# Altium schematic sheet Vibration_Datalogger_1.SchDoc: Title (part 1 of 7)
size 594 x 420 mm; CheckedBy: None; Author: *******; Engineer: *******; DocumentNumber: Doc Num; Revision: *******; SheetNumber: 1; SheetTotal: 1; Date: *******; ApprovedBy: *******; CompanyName: *******; DrawnBy: Name; Organization: *******; Address1: *******; Address2: *******; Address3: *******; Address4: *******; CurrentDate: *******; DocumentName: *******; CurrentTime: *******; Time: *******; DocumentFullPathAndName: *******; ModifiedDate: *******; ImagePath: *******; ProjectName: *******; Application_BuildNumber: *******
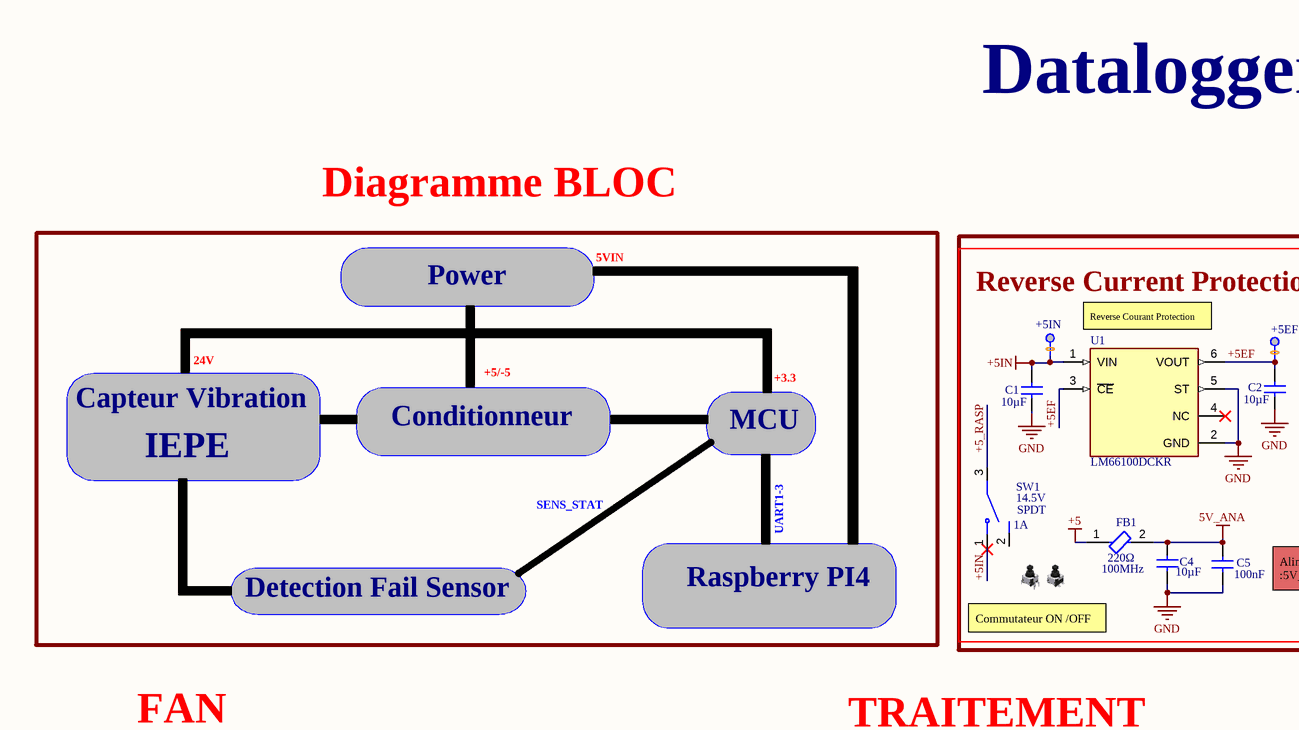
[diagram p0: Vibration_Datalogger_1.SchDoc, top left]
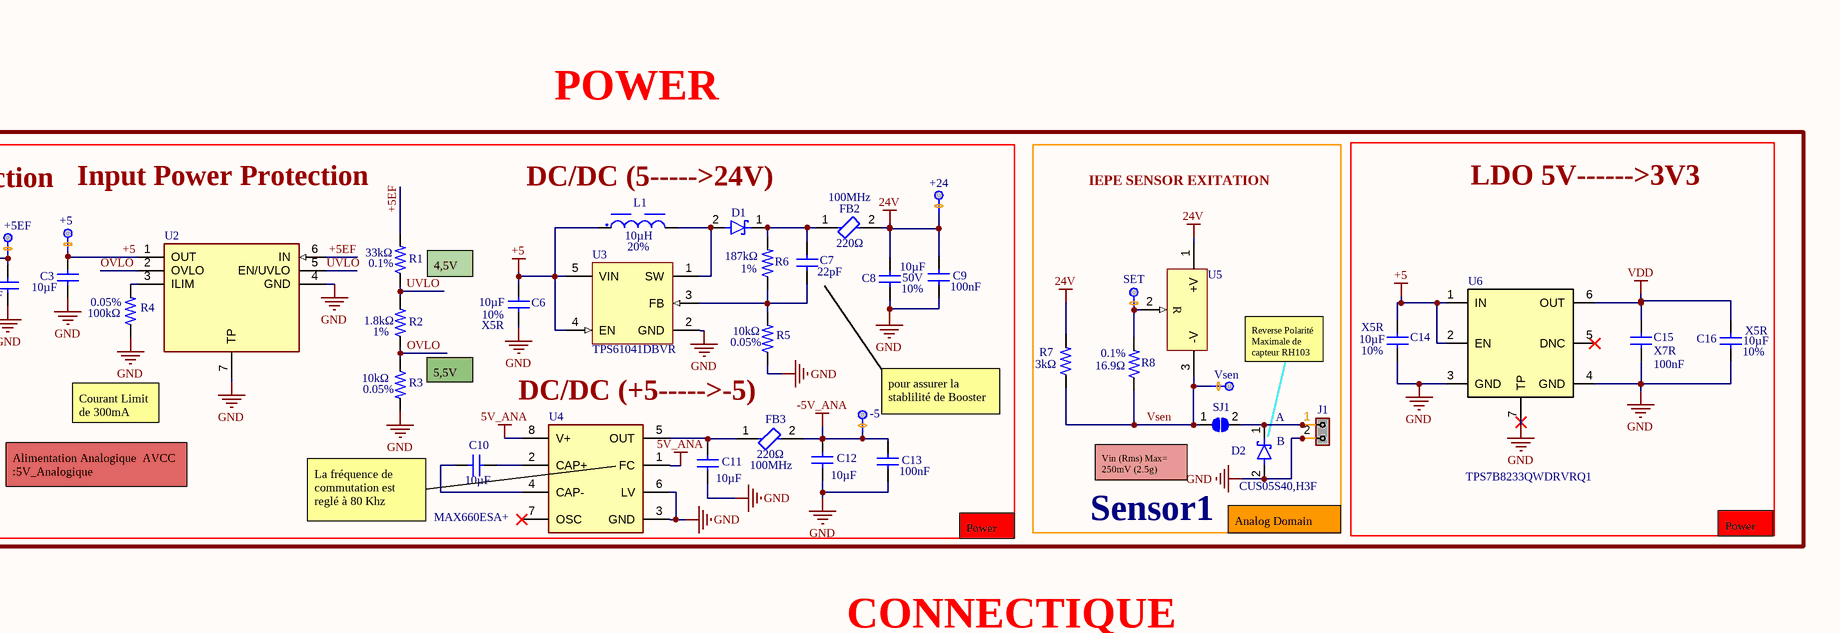
[diagram p1: Vibration_Datalogger_1.SchDoc, top right]
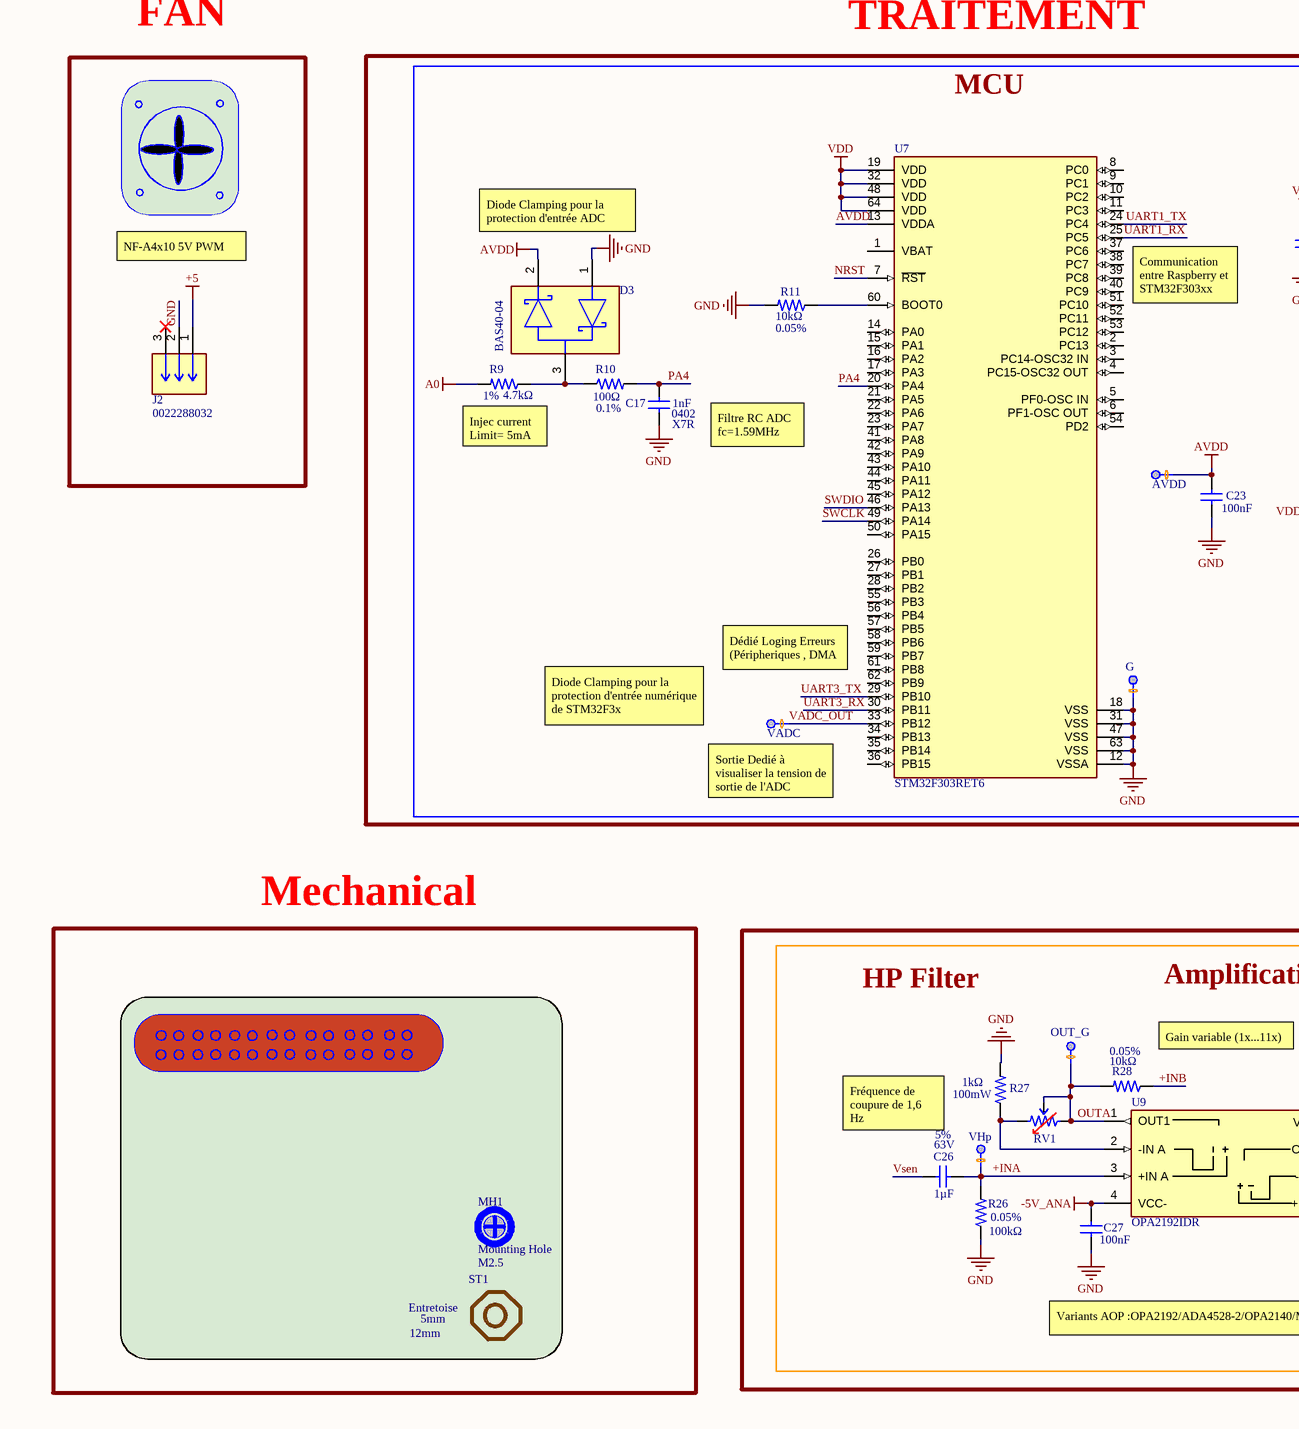
[diagram p2: Vibration_Datalogger_1.SchDoc, bottom left]
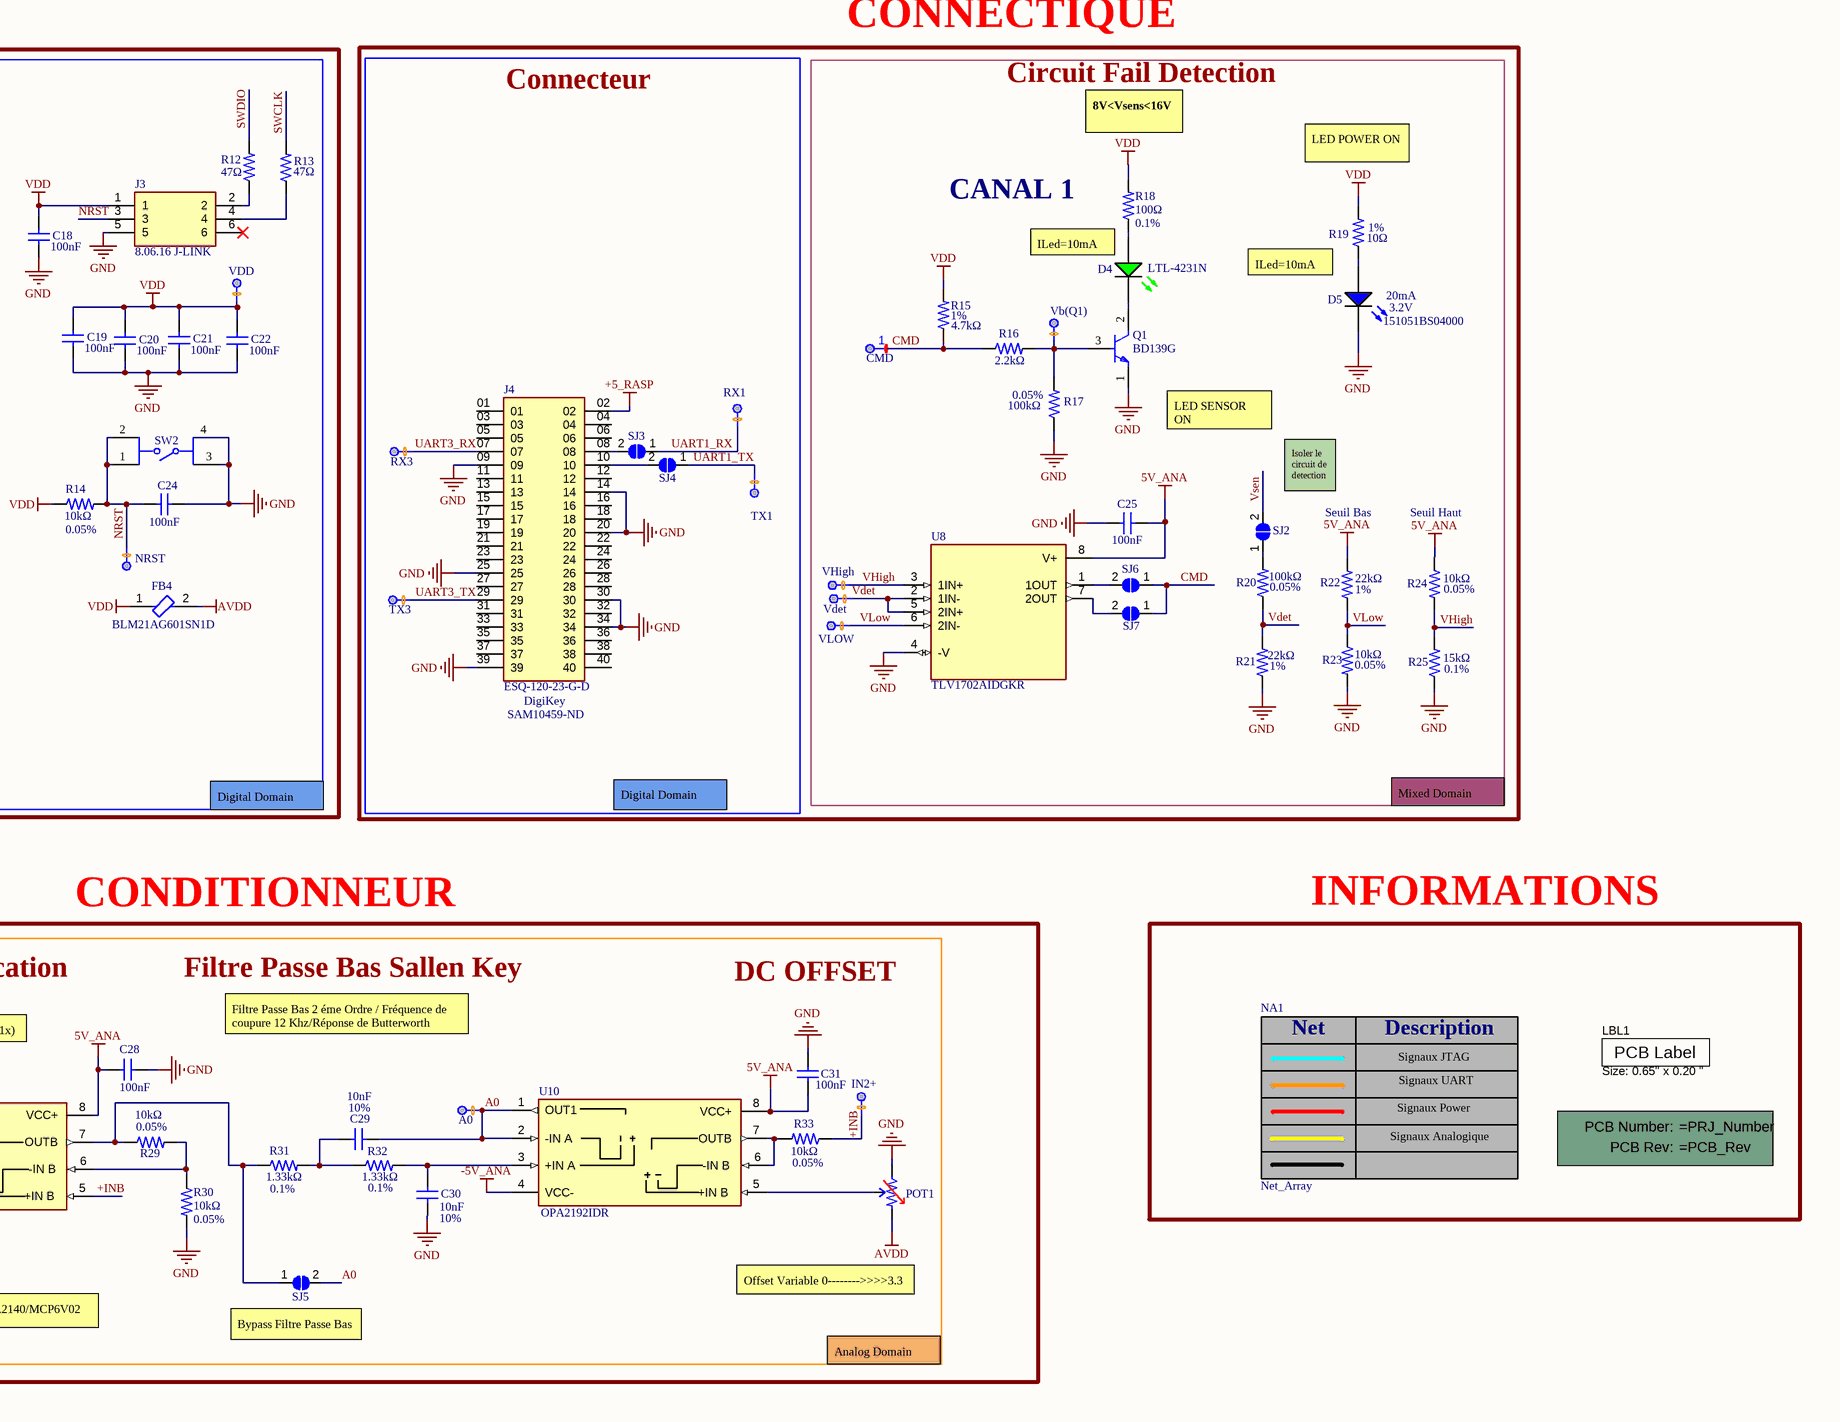
[diagram p3: Vibration_Datalogger_1.SchDoc, bottom right]

## Parts
+5  Test_point_TH  [Test_Point_TH]  (value not drawn)  (no BOM)
+5EF  Test_point_TH  [Test_Point_TH]  (value not drawn)  (no BOM)
+5IN  Test_point_TH  [Test_Point_TH]  (value not drawn)  (no BOM)
+24  Test_point_TH  [Test_Point_TH]  (value not drawn)  (no BOM)
-5  Test_point_TH  [Test_Point_TH]  (value not drawn)  (no BOM)
A0  Test_point_TH  [Test_Point_TH]  (value not drawn)  (no BOM)
AVDD  Test_point_TH  [Test_Point_TH]  (value not drawn)  (no BOM)
C1  Capacitance: 10µF  [GRM21BR71A106KA73L]  (hidden comment: GRM21BR71A106KA73L)
C2  Capacitance: 10µF  [GRM21BR71A106KA73L]  (hidden comment: GRM21BR71A106KA73L)
C3  Capacitance: 10µF  [GRM21BR71A106KA73L]  (hidden comment: GRM21BR71A106KA73L)
C4  Capacitance: 10µF  [GRM21BR71A106KA73L]  (hidden comment: GRM21BR71A106KA73L)
C5  Capacitance: 100nF  [CC0603KRX7R7BB104]  (hidden comment: CC0603KRX7R9BB104)
C6  Capacitance: 10µF  Dielectric: X5R  Tolerance: 10%  [GRM21BR61E106KA73L]  (hidden comment: GRM21BR61E106KA73L)
C7  Capacitance: 22pF  [GRM1555C1H220JA01D]  (hidden comment: GRM1555C1H220JA01D)
C8  Capacitance: 10µF  Voltage Rating: 50V  Tolerance: 10%  [CL31B106KBHNNNE]  (hidden comment: CL31B106KBHNNNE)
C9  Capacitance: 100nF  [CC0603KRX7R7BB104]  (hidden comment: CC0603KRX7R9BB104)
C10  Capacitance: 10µF  [GRM21BR71A106KA73L]  (hidden comment: GRM21BR71A106KA73L)
C11  Capacitance: 10µF  [GRM21BR71A106KA73L]  (hidden comment: GRM21BR71A106KA73L)
C12  Capacitance: 10µF  [GRM21BR71A106KA73L]  (hidden comment: GRM21BR71A106KA73L)
C13  Capacitance: 100nF  [CC0603KRX7R7BB104]  (hidden comment: CC0603KRX7R9BB104)
C14  Capacitance: 10µF  Dielectric: X5R  Tolerance: 10%  [GRM21BR61E106KA73L]  (hidden comment: GRM21BR61E106KA73L)
C15  Dielectric: X7R  Capacitance: 100nF  [CC0603KRX7R7BB104]  (hidden comment: CC0603KRX7R9BB104)
C16  Capacitance: 10µF  Dielectric: X5R  Tolerance: 10%  [GRM21BR61E106KA73L]  (hidden comment: GRM21BR61E106KA73L)
C17  Dielectric: X7R  Case/Package: 0402  Capacitance: 1nF  [CC0402KRX7R9BB102]  (hidden comment: CC0402KRX7R9BB102)
C18  Capacitance: 100nF  [CC0603KRX7R7BB104]  (hidden comment: CC0603KRX7R9BB104)
C19  Capacitance: 100nF  [CC0603KRX7R7BB104]  (hidden comment: CC0603KRX7R9BB104)
C20  Capacitance: 100nF  [CC0603KRX7R7BB104]  (hidden comment: CC0603KRX7R9BB104)
C21  Capacitance: 100nF  [CC0603KRX7R7BB104]  (hidden comment: CC0603KRX7R9BB104)
C22  Capacitance: 100nF  [CC0603KRX7R7BB104]  (hidden comment: CC0603KRX7R9BB104)
C23  Capacitance: 100nF  [CC0603KRX7R7BB104]  (hidden comment: CC0603KRX7R9BB104)
C24  Capacitance: 100nF  [CC0603KRX7R7BB104]  (hidden comment: CC0603KRX7R9BB104)
C25  Capacitance: 100nF  [CC0603KRX7R7BB104]  (hidden comment: CC0603KRX7R9BB104)
C26  Capacitance: 1µF  Tolerance: 5%  Voltage Rating: 63V  [B32529C0105J189]  (hidden comment: B32529C0105J189)
C27  Capacitance: 100nF  [CC0402KRX7R7BB104]  (hidden comment: CC0402KRX7R7BB104)
C28  Capacitance: 100nF  [CC0402KRX7R7BB104]  (hidden comment: CC0402KRX7R7BB104)
C29  Tolerance: 10%  Capacitance: 10nF  [C0603C103K5RAC7411]  (hidden comment: C0603C103K5RAC7411)
C30  Tolerance: 10%  Capacitance: 10nF  [C0603C103K5RAC7411]  (hidden comment: C0603C103K5RAC7411)
C31  Capacitance: 100nF  [CC0402KRX7R7BB104]  (hidden comment: CC0402KRX7R7BB104)
CMD  Test_Point_SMD  [Test_point_SMD]  (value not drawn)  (no BOM)
D1  CUS05S40,H3F  [CUS05S40,H3F]  (value not drawn)
D2  CUS05S40,H3F  [CUS05S40,H3F]
D3  BAS40-04  [BAS40-04]
D4  LTL-4231N  [LTL-4233]
D5  151051BS04000  Test Current: 20mA  Forward Voltage: 3.2V  [151051BS04000]
FB1  Impedance: 220Ω  Frequency: 100MHz  [BLM21PG221SN1D]  (hidden comment: BLM21PG221SN1D)
FB2  Impedance: 220Ω  Frequency: 100MHz  [BLM21PG221SN1D]  (hidden comment: BLM21PG221SN1D)
FB3  Impedance: 220Ω  Frequency: 100MHz  [BLM21PG221SN1D]  (hidden comment: BLM21PG221SN1D)
FB4  BLM21AG601SN1D  [FP-BLM21-0_2-t0_85-e0_5-IPC_A]
G  Test_point_TH  [Test_Point_TH]  (value not drawn)  (no BOM)
IN2+  Test_point_TH  [Test_Point_TH]  (value not drawn)  (no BOM)
J1  691411410002  [691411410002]  (value not drawn)
J2  0022288032  [0022288032]
J3  8.06.16 J-LINK  [8.06.16 J-LINK]  (no BOM)
J4  ESQ-120-23-G-D  Supplier 1: DigiKey  Supplier Part Number 1: SAM10459-ND  [ESQ-120-23-G-D]
L1  Inductance: 10µH  Inductance Tolerance: 20%  [74438357100]  (hidden comment: 74438357100)
LBL1  Size: 0.65" x 0.20 "  [Label_650x200]  (graphical)
MH1  Mounting Hole  Diamétre interne: M2.5  [Mounting Hole]  (no BOM)
NA1  Net_Array  (no BOM)
NRST  Test_point_TH  [Test_Point_TH]  (value not drawn)  (no BOM)
OUT_G  Test_point_TH  [Test_Point_TH]  (value not drawn)  (no BOM)
PCB_Fiche  Printed Circuit Board  (value not drawn)  (graphical)
POT1  3296W-1-103LF  [3296W-1-103LF]  (value not drawn)
Q1  BD139G  [FP-77-09-MFG]
R1  Resistance: 33kΩ  Tolerance: 0.1%  [RC0402FR-1333KL]  (hidden comment: RC0402FR-1333KL)
R2  Tolerance: 1%  Resistance: 1.8kΩ  [RC0603FR-071K8L]  (hidden comment: RC0603FR-071K8L)
R3  Resistance: 10kΩ  Tolerance: 0.05%  [RG2012N-103-W-T1]  (hidden comment: RG2012N-103-W-T1)
R4  Tolerance: 0.05%  Resistance: 100kΩ  [ERA-3ARW104V]  (hidden comment: ERA-3ARW104V)
R5  Resistance: 10kΩ  Tolerance: 0.05%  [RG2012N-103-W-T1]  (hidden comment: RG2012N-103-W-T1)
R6  Tolerance: 1%  Resistance: 187kΩ  [RMCF0402FT187K]  (hidden comment: RMCF0402FT187K)
R7  Resistance: 3kΩ  [ERA-3AEB302V]  (hidden comment: ERA-3AEB302V)
R8  Tolerance: 0.1%  Resistance: 16.9Ω  [CPF0603B16R9E1]  (hidden comment: CPF0603B16R9E1)
R9  Tolerance: 1%  Resistance: 4.7kΩ  [RC0402FR-074K7L]  (hidden comment: RC0402FR-074K7L)
R10  Resistance: 100Ω  Tolerance: 0.1%  [RNCF0603BTE100R]  (hidden comment: RNCF0603BTE100R)
R11  Resistance: 10kΩ  Tolerance: 0.05%  [RG2012N-103-W-T1]  (hidden comment: RG2012N-103-W-T1)
R12  Resistance: 47Ω  [RC0603FR-0747RL]  (hidden comment: RC0603FR-0747RL)
R13  Resistance: 47Ω  [RC0603FR-0747RL]  (hidden comment: RC0603FR-0747RL)
R14  Resistance: 10kΩ  Tolerance: 0.05%  [RG2012N-103-W-T1]  (hidden comment: RG2012N-103-W-T1)
R15  Tolerance: 1%  Resistance: 4.7kΩ  [RC0402FR-074K7L]  (hidden comment: RC0402FR-074K7L)
R16  Resistance: 2.2kΩ  [RT0603DRD072K2L]  (hidden comment: RT0603DRD072K2L)
R17  Tolerance: 0.05%  Resistance: 100kΩ  [ERA-3ARW104V]  (hidden comment: ERA-3ARW104V)
R18  Resistance: 100Ω  Tolerance: 0.1%  [RNCF0603BTE100R]  (hidden comment: RNCF0603BTE100R)
R19  Tolerance: 1%  Resistance: 10Ω  [RC0603FR-0710RL]  (hidden comment: RC0603FR-0710RL)
R20  Tolerance: 0.05%  Resistance: 100kΩ  [ERA-3ARW104V]  (hidden comment: ERA-3ARW104V)
R21  Tolerance: 1%  Resistance: 22kΩ  [RC0402FR-0722KL]  (hidden comment: RC0402FR-0722KL)
R22  Tolerance: 1%  Resistance: 22kΩ  [RC0402FR-0722KL]  (hidden comment: RC0402FR-0722KL)
R23  Resistance: 10kΩ  Tolerance: 0.05%  [RG2012N-103-W-T1]  (hidden comment: RG2012N-103-W-T1)
R24  Resistance: 10kΩ  Tolerance: 0.05%  [RG2012N-103-W-T1]  (hidden comment: RG2012N-103-W-T1)
R25  Resistance: 15kΩ  Tolerance: 0.1%  [RT0402BRD0715KL]  (hidden comment: RT0402BRD0715KL)
R26  Tolerance: 0.05%  Resistance: 100kΩ  [ERA-3ARW104V]  (hidden comment: ERA-3ARW104V)
R27  Power Rating: 100mW  Resistance: 1kΩ  [RC0603FR-071KL]  (hidden comment: RC0603FR-071KL)
R28  Resistance: 10kΩ  Tolerance: 0.05%  [RG2012N-103-W-T1]  (hidden comment: RG2012N-103-W-T1)
R29  Resistance: 10kΩ  Tolerance: 0.05%  [RG2012N-103-W-T1]  (hidden comment: RG2012N-103-W-T1)
R30  Resistance: 10kΩ  Tolerance: 0.05%  [RG2012N-103-W-T1]  (hidden comment: RG2012N-103-W-T1)
R31  Resistance: 1.33kΩ  Tolerance: 0.1%  [ERA-3AEB1331V]  (hidden comment: ERA-3AEB1331V)
R32  Resistance: 1.33kΩ  Tolerance: 0.1%  [ERA-3AEB1331V]  (hidden comment: ERA-3AEB1331V)
R33  Resistance: 10kΩ  Tolerance: 0.05%  [RG2012N-103-W-T1]  (hidden comment: RG2012N-103-W-T1)
RV1  3296W-1-103LF  [3296W-1-103LF]  (value not drawn)
RX1  Test_point_TH  [Test_Point_TH]  (value not drawn)  (no BOM)
RX3  Test_point_TH  [Test_Point_TH]  (value not drawn)  (no BOM)
SET  Test_point_TH  [Test_Point_TH]  (value not drawn)  (no BOM)
SJ1  Solder Jumper  [Solder Jumper]  (value not drawn)  (no BOM)
SJ2  Solder Jumper  [Solder Jumper]  (value not drawn)  (no BOM)
SJ3  Solder Jumper  [Solder Jumper]  (value not drawn)  (no BOM)
SJ4  Solder Jumper  [Solder Jumper]  (value not drawn)  (no BOM)
SJ5  Solder Jumper  [Solder Jumper]  (value not drawn)  (no BOM)
SJ6  Solder Jumper  [Solder Jumper]  (value not drawn)  (no BOM)
SJ7  Solder Jumper  [Solder Jumper]  (value not drawn)  (no BOM)
ST1  Entretoise  Width: 5mm  Length: 12mm  [970120154]  (mechanical)
SW1  Voltage Rating (DC): 14.5V  Throw Configuration: SPDT  Current Rating: 1A  [SPEF110100]  (hidden comment: SPEF110100)
SW2  TL3301AF260QG  [TL3301AF260QG]  (value not drawn)
TX1  Test_point_TH  [Test_Point_TH]  (value not drawn)  (no BOM)
TX3  Test_point_TH  [Test_Point_TH]  (value not drawn)  (no BOM)
U1  LM66100DCKR  [LM66100DCKR]
U2  TPS25961DRVR  [TPS25961DRVR]  (value not drawn)
U3  TPS61041DBVR  [TPS61041DBVR]
U4  MAX660ESA+  [MAX660ESA+]
U5  LM234Z-3/NOPB  [LM234Z-3/NOPB]  (value not drawn)
U6  TPS7B8233QWDRVRQ1  [TPS7B8233QWDRVRQ1]
U7  STM32F303RET6  [STM32F303RET6]
U8  TLV1702AIDGKR  [TLV1702AIDGKR]
U9  OPA2192IDR  [OPA2192IDR]
U10  OPA2192IDR  [OPA2192IDR]
VADC  Test_point_TH  [Test_Point_TH]  (value not drawn)  (no BOM)
Vb(Q1)  Test_point_TH  [Test_Point_TH]  (value not drawn)  (no BOM)
VDD  Test_point_TH  [Test_Point_TH]  (value not drawn)  (no BOM)
Vdet  Test_point_TH  [Test_Point_TH]  (value not drawn)  (no BOM)
VHigh  Test_point_TH  [Test_Point_TH]  (value not drawn)  (no BOM)
VHp  Test_point_TH  [Test_Point_TH]  (value not drawn)  (no BOM)
VLOW  Test_point_TH  [Test_Point_TH]  (value not drawn)  (no BOM)
Vsen  Test_point_TH  [Test_Point_TH]  (value not drawn)  (no BOM)

## Blocks framed on the sheet
Sensor1: D2 J1 R7 R8 SET SJ1 U5 Vsen
LDO 5V------>3V3: C14-C16 U6
MCU: AVDD C17-C24 D3 FB4 G J3 NRST R9-R14 SW2 U7 VADC VDD
CONNECTIQUE: C25 CMD D4 D5 Q1 R15-R25 SJ2 SJ6 SJ7 U8 Vb(Q1) Vdet VHigh VLOW
Connecteur: J4 RX1 RX3 SJ3 SJ4 TX1 TX3
Mechanical: MH1 ST1
CONDITIONNEUR: A0 C26-C31 IN2+ OUT_G POT1 R26-R33 RV1 SJ5 U9 U10 VHp
INFORMATIONS: LBL1 NA1 PCB_Fiche

## Nets
5V_ANA: C4.1(P) C5.1(P) C25.1(P) C28.1(P) C31.2(N) FB1.2 R22.2 R24.1 U4.1(FC) U4.8(V+) U8.8(V+) U9.8(VCC+) U10.8(VCC+)
24V: +24.1 C8.1(P) C9.1(P) FB2.2 R7.2 U5.1(+V)
+5: +5.1 C3.1(P) C6.1(P) C14.1(P) FB1.1 J2.1 L1.1 U2.1(OUT) U3.4(EN) U3.5(VIN) U6.1(IN) U6.2(EN)
+5_RASP: J4.02 SW1.3(c)
+5IN: +5IN.1 C1.1(P) SW1.1 U1.1(VIN)
-5V_ANA: -5.1 C12.2(N) C13.1(P) C27.1(P) FB3.2 U9.4(VCC-) U10.4(VCC-)
A0: A0.1 C29.2(N) R9.2 SJ5.2(SJ2) U10.1(OUT1) U10.2(-IN_A)
AVDD: AVDD.1 C23.2(N) D3.2 FB4.2 POT1.3(CW) U7.13(VDDA)
GND: C1.2(N) C2.2(N) C3.2(N) C4.2(N) C5.2(N) C6.2(N) C8.2(N) C9.2(N) C11.1(P) C12.1(P) C13.2(N) C14.2(N) C15.2(N) C16.2(N) C17.2(N) C18.2(N) C19.2(N) C20.2(N) C21.2(N) C22.2(N) C23.1(P) C24.2(N) C25.2(N) C27.2(N) C28.2(N) C30.2(N) C31.1(P) D2.2(A) D3.1 D5.2(K) G.1 J1.2 J1.A2 J2.2 J3.5 J4.09 J4.14 J4.20 J4.25 J4.30 J4.34 J4.39 POT1.1(CCW) Q1.1(E) R3.2 R4.1 R5.1 R11.2 R17.1 R21.1 R23.2 R25.1 R26.1 R27.2 R30.2 SW2.3 SW2.4 U1.2(GND) U1.5(ST) U2.4(GND) U2.7(TP) U3.2(GND) U4.3(GND) U4.6(LV) U6.3(GND) U6.4(GND) U6.7(TP) U7.12(VSSA) U7.18(VSS) U7.31(VSS) U7.47(VSS) U7.63(VSS) U8.4(-V)
VDD: C15.1(P) C16.1(P) C18.1(P) C19.1(P) C20.1(P) C21.1(P) C22.1(P) FB4.1 J3.1 R14.1 R15.2 R18.2 R19.2 U6.6(OUT) U7.19(VDD) U7.32(VDD) U7.48(VDD) U7.64(VDD) VDD.1
+5EF: +5EF.1 C2.1(P) R1.2 U1.3(~{CE}) U1.6(VOUT) U2.6(IN)
+INA: C26.2(N) R26.2 U9.3(+IN_A) VHp.1
+INB: IN2+.1 R28.1 R33.1 U9.5(+IN_B)
CMD: CMD.1 R15.1 R16.1 SJ6.1(SJ1) SJ7.1(SJ1)
NRST: C24.1(P) J3.3 NRST.1 R14.2 SW2.1 SW2.2 U7.7(~{RST})
OUTA: OUT_G.1 R28.2 RV1.1(CCW) RV1.2(WIPER) U9.1(OUT1)
OVLO: R2.1 R3.1 U2.2(OVLO)
PA4: C17.1(P) R10.2 U7.20(PA4)
SWCLK: R13.2 U7.49(PA14)
SWDIO: R12.2 U7.46(PA13)
UART1_RX: RX1.1 SJ3.1(SJ1) U7.25(PC5)
UART1_TX: SJ4.1(SJ1) TX1.1 U7.24(PC4)
UART3_RX: J4.07 RX3.1 U7.30(PB11)
UART3_TX: J4.29 TX3.1 U7.29(PB10)
UVLO: R1.1 R2.2 U2.5(EN/UVLO)
VADC_OUT: U7.33(PB12) VADC.1
Vdet: R20.1 R21.2 U8.2(1IN-) U8.5(2IN+) Vdet.1
VHigh: R24.2 R25.2 U8.3(1IN+) VHigh.1
VLow: R22.1 R23.1 U8.6(2IN-) VLOW.1
Vsen: C26.1(P) R7.1 R8.1 SJ1.1(SJ1) SJ2.2(SJ2) U5.3(-V) Vsen.1
NetC7_1: C7.1(P) D1.1(C) FB2.1 R6.2
NetC7_2: C7.2(N) R5.2 R6.1 U3.3(FB)
NetC10_1: C10.1(P) U4.2(CAP+)
NetC10_2: C10.2(N) U4.4(CAP-)
NetC11_2: C11.2(N) FB3.1 U4.5(OUT)
NetC29_1: C29.1(P) R31.2 R32.1
NetC30_1: C30.1(P) R32.2 U10.3(+IN_A)
NetD1_2: D1.2(A) L1.2 U3.1(SW)
NetD2_1: D2.1(C) J1.1 J1.A1 SJ1.2(SJ2)
NetD3_3: D3.3 R9.1 R10.1
NetD4_1: D4.1(A) R18.1
NetD4_2: D4.2(K) Q1.2(C)
NetD5_1: D5.1(A) R19.1
NetJ3_2: J3.2 R12.1
NetJ3_4: J3.4 R13.1
NetJ4_08: J4.08 SJ3.2(SJ2)
NetJ4_10: J4.10 SJ4.2(SJ2)
NetPOT1_2: POT1.2(WIPER) U10.5(+IN_B)
NetQ1_3: Q1.3(B) R16.2 R17.2 Vb(Q1).1
NetR4_2: R4.2 U2.3(ILIM)
NetR8_2: R8.2 SET.1 U5.2(R)
NetR11_1: R11.1 U7.60(BOOT0)
NetR20_2: R20.2 SJ2.1(SJ1)
NetR27_1: R27.1 RV1.3(CW) U9.2(-IN_A)
NetR29_1: R29.1 R31.1 SJ5.1(SJ1) U9.7(OUTB)
NetR29_2: R29.2 R30.1 U9.6(-IN_B)
NetR33_2: R33.2 U10.6(-IN_B) U10.7(OUTB)
NetSJ6_2: SJ6.2(SJ2) U8.1(1OUT)
NetSJ7_2: SJ7.2(SJ2) U8.7(2OUT)

Not connected (* = marked no-connect by the designer): J2 3*; J3 6*; J4 01 03 04 05 06 11 12 13 15 16 17 18 19 21 22 23 24 26 27 28 31 32 33 35 36 37 38 40; SW1 2; U1 4(NC)*; U4 7(OSC)*; U6 5(DNC)*; U7 1(VBAT) 2(PC13) 3(PC14-OSC32_IN) 4(PC15-OSC32_OUT) 5(PF0-OSC_IN) 6(PF1-OSC_OUT) 8(PC0) 9(PC1) 10(PC2) 11(PC3) 14(PA0) 15(PA1) 16(PA2) 17(PA3) 21(PA5) 22(PA6) 23(PA7) 26(PB0) 27(PB1) 28(PB2) 34(PB13) 35(PB14) 36(PB15) 37(PC6) 38(PC7) 39(PC8) 40(PC9) 41(PA8) 42(PA9) 43(PA10) 44(PA11) 45(PA12) 50(PA15) 51(PC10) 52(PC11) 53(PC12) 54(PD2) 55(PB3) 56(PB4) 57(PB5) 58(PB6) 59(PB7) 61(PB8) 62(PB9)

## Notes on the sheet
- Datalogger Vibratoire MonoCanal
- Diagramme BLOC
- POWER
- Power
- 5VIN
- Reverse Current Protection
- Input Power Protection
- DC/DC (5----->24V)
- IEPE SENSOR EXITATION
- 24V
- +5/-5
- Reverse Courant Protection
- 4,5V
- Capteur Vibration
- Conditionneur
- MCU
- +3.3
- IEPE
- SENS_STAT
- 5,5V
- DC/DC (+5----->-5)
- (near -5) pour assurer la stablilité de Booster
- Reverse Polarité Maximale de capteur RH103
- UART1-3
- (near U2) Courant Limit de 300mA
- (near SJ1) Vin (Rms) Max= 250mV (2.5g)
- (near D2) A
- (near D2) B
- Detection Fail Sensor
- Raspberry PI4
- Commutateur ON /OFF
- (near C5) Alimentation Analogique  AVCC :5V_Analogique
- La fréquence de commutation est reglé à 80 Khz
- (near D2) Analog Domain
- FAN
- TRAITEMENT
- Circuit Fail Detection
- 8V<Vsens<16V
- CANAL 1
- LED POWER ON
- NF-A4x10 5V PWM
- Diode Clamping pour la protection d'entrée ADC
- ILed=10mA
- (near U7) Communication entre Raspberry et STM32F303xx
- (near R9) Injec current Limit= 5mA
- (near C17) Filtre RC ADC   fc=1.59MHz
- (near Q1) LED SENSOR ON
- (near SJ2) Isoler le circuit de detection
- Seuil Bas
- (near R24) Seuil Haut
- Dédié Loging Erreurs (Péripheriques , DMA ......)
- Diode Clamping pour la protection d'entrée numérique de STM32F3x
- (near VADC) Sortie Dedié à visualiser la tension de sortie de l'ADC
- Digital Domain
- Mixed Domain Domain
- HP Filter
- Amplification
- Filtre Passe Bas Sallen Key
- DC OFFSET
- (near R28) Gain variable (1x...11x)
- Filtre Passe Bas 2 éme Ordre / Fréquence de coupure 12 Khz/Réponse de Butterworth
- (near NA1) Signaux JTAG
- (near NA1) Signaux UART
- Fréquence de coupure de 1,6 Hz
- Signaux Analogique
- (near NA1) Signaux Power
- Offset Variable 0-------->>>>3.3
- Variants AOP :OPA2192/ADA4528-2/OPA2140/MCP6V02
- (near SJ5) Bypass Filtre Passe Bas
- Analog Domain
- DWG. NO.
- REV.
- SHT.
- REVISION
- DWG NO:
- DESCRIPTION
- REV:
- DATE
- APPROVED
- THIS DOCUMENT AND THE DATA DISCLOSED HEREIN OR
- HEREWITH IS THE PROPERTY OF ALTIUM LIMITED AND MAY
- BE FREELY DISTRIBUTED IN WHOLE. NO RIGHTS ARE
- RESERVED OR EXPRESS OR IMPLIED WARANTEE GIVEN.
- THIS DOCUMENT AND THE DATA DISCLOSED HEREIN OR HEREWITH IS THE PROPERTY OF ALTIUM LIMITED AND MAY BE FREELY DISTRIBUTED IN WHOLE. NO RIGHTS ARE RESERVED OR EXPRESS OR IMPLIED WARANTEE GIVEN.
- ENG:
- DSN:
- APPROVALS
- Title:
- PROJECT
- DOCUMENT REVISION:
- DESIGN ITEM:
- CHK:
- BOM:
- REFERENCE DOCUMENTS
- Size:
- Drawn By:
- Page Contents:
- A4
- PROJECT REVISION:
- TITLE
- Number:
- Checked By:
- Revision:
- FAB DWG:
- PCB DWG:
- ASSY DWG:
- Date:
- File:
- License:
- Email:
- SCALE:
- Time:
- SIZE
- C
- CAGE CODE
- FILE NAME
- DWG NO.
- Sheet
- Website:
- of
- A2
- SHEET
- OF
- REV
- (in symbol Net_Array) Net; Description
- (in symbol PCB) PCB Number:; PCB Rev:
- (in symbol THT-14-423-10) PCB Label